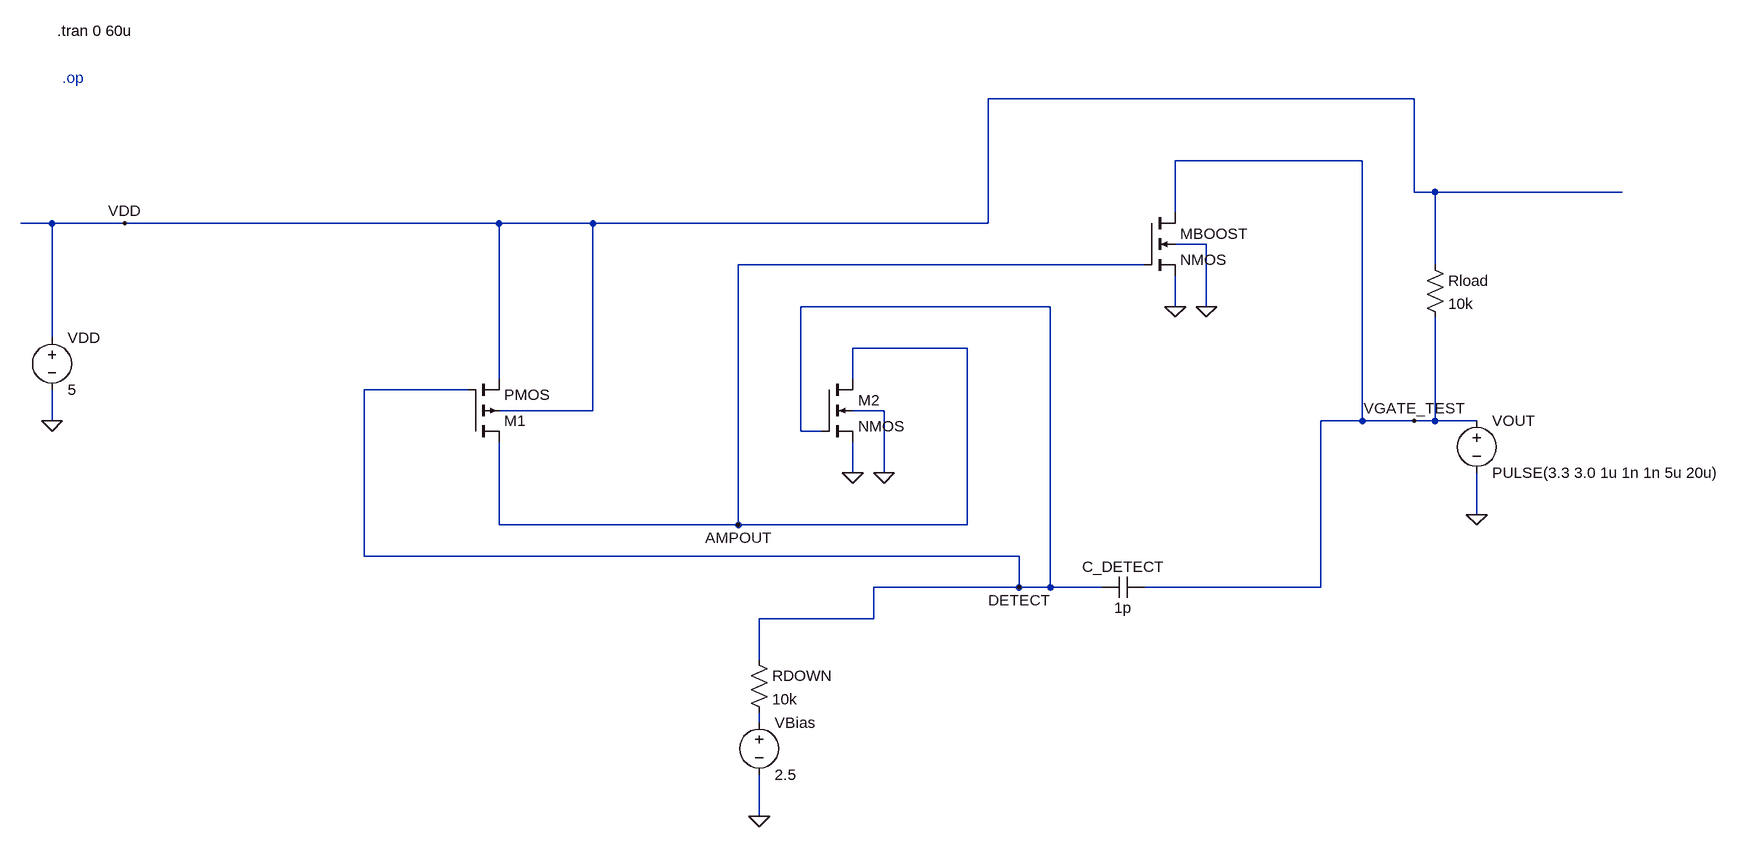
[diagram p0: schematic Booster_Circuit.asc]
Booster_Circuit.asc, the LTspice schematic file:
Version 4.1
SHEET 1 2028 772
WIRE 1536 -352 880 -352
WIRE 1456 -256 1168 -256
WIRE 1536 -208 1536 -352
WIRE 1568 -208 1536 -208
WIRE 1856 -208 1568 -208
WIRE 1168 -176 1168 -256
WIRE -560 -160 -608 -160
WIRE -448 -160 -560 -160
WIRE 128 -160 -448 -160
WIRE 272 -160 128 -160
WIRE 880 -160 880 -352
WIRE 880 -160 272 -160
WIRE 1216 -128 1168 -128
WIRE 1120 -96 496 -96
WIRE 1568 -96 1568 -208
WIRE 976 -32 592 -32
WIRE 1168 -32 1168 -80
WIRE 1216 -32 1216 -128
WIRE -560 16 -560 -160
WIRE 848 32 672 32
WIRE 128 80 128 -160
WIRE 672 80 672 32
WIRE 80 96 -80 96
WIRE 272 128 272 -160
WIRE 272 128 128 128
WIRE 720 128 672 128
WIRE -560 144 -560 96
WIRE 1456 144 1456 -256
WIRE 1456 144 1392 144
WIRE 1536 144 1456 144
WIRE 1568 144 1568 -16
WIRE 1568 144 1536 144
WIRE 1632 144 1568 144
WIRE 592 160 592 -32
WIRE 624 160 592 160
WIRE 672 224 672 176
WIRE 720 224 720 128
WIRE 1632 288 1632 224
WIRE 128 304 128 176
WIRE 496 304 496 -96
WIRE 496 304 128 304
WIRE 848 304 848 32
WIRE 848 304 496 304
WIRE -80 352 -80 96
WIRE 928 352 -80 352
WIRE 928 400 928 352
WIRE 928 400 704 400
WIRE 976 400 976 -32
WIRE 976 400 928 400
WIRE 1056 400 976 400
WIRE 1392 400 1392 144
WIRE 1392 400 1120 400
WIRE 704 448 704 400
WIRE 704 448 528 448
WIRE 528 512 528 448
WIRE 528 608 528 592
WIRE 528 752 528 688
FLAG 672 224 0
FLAG 720 224 0
FLAG 496 304 AMPOUT
FLAG -560 144 0
FLAG 928 400 DETECT
FLAG 1632 288 0
FLAG 1168 -32 0
FLAG 1216 -32 0
FLAG 1536 144 VGATE_TEST
FLAG -448 -160 VDD
FLAG 528 752 0
SYMBOL pmos4 80 176 M180
SYMATTR InstName M1
SYMATTR Value2 l=180n w=20u
SYMBOL voltage -560 0 R0
WINDOW 123 0 0 Left 0
WINDOW 39 0 0 Left 0
SYMATTR InstName VDD
SYMATTR Value 5
SYMBOL nmos4 624 80 R0
SYMATTR InstName M2
SYMATTR Value2 l=180n w=10u
SYMBOL voltage 1632 128 R0
WINDOW 123 0 0 Left 0
WINDOW 39 0 0 Left 0
SYMATTR InstName VOUT
SYMATTR Value PULSE(3.3 3.0 1u 1n 1n 5u 20u)
SYMBOL cap 1120 384 R90
WINDOW 0 0 32 VBottom 2
WINDOW 3 32 32 VTop 2
SYMATTR InstName C_DETECT
SYMATTR Value 1p
SYMBOL nmos4 1120 -176 R0
SYMATTR InstName MBOOST
SYMATTR Value2 l=180n w=500u
SYMBOL res 512 496 R0
SYMATTR InstName RDOWN
SYMATTR Value 10k
SYMBOL voltage 528 592 R0
SYMATTR InstName VBias
SYMATTR Value 2.5
SYMBOL res 1552 -112 R0
SYMATTR InstName Rload
SYMATTR Value 10k
TEXT -552 -456 Left 2 !.tran 0 60u
TEXT -544 -384 Left 2 ;.op

The netlist it stands for:
* Booster_Circuit.asc
M1 AMPOUT DETECT VDD VDD PMOS l=180n w=20u
VDD VDD 0 5
M2 AMPOUT DETECT 0 0 NMOS l=180n w=10u
VOUT VGATE_TEST 0 PULSE(3.3 3.0 1u 1n 1n 5u 20u)
C_DETECT VGATE_TEST DETECT 1p
MBOOST VGATE_TEST AMPOUT 0 0 NMOS l=180n w=500u
RDOWN DETECT N001 10k
VBias N001 0 2.5
Rload VDD VGATE_TEST 10k
.model NMOS NMOS
.model PMOS PMOS
.lib standard.mos
.tran 0 60u
* .op
.backanno
.end